# Altium project Turret_Driver.PrjPcb
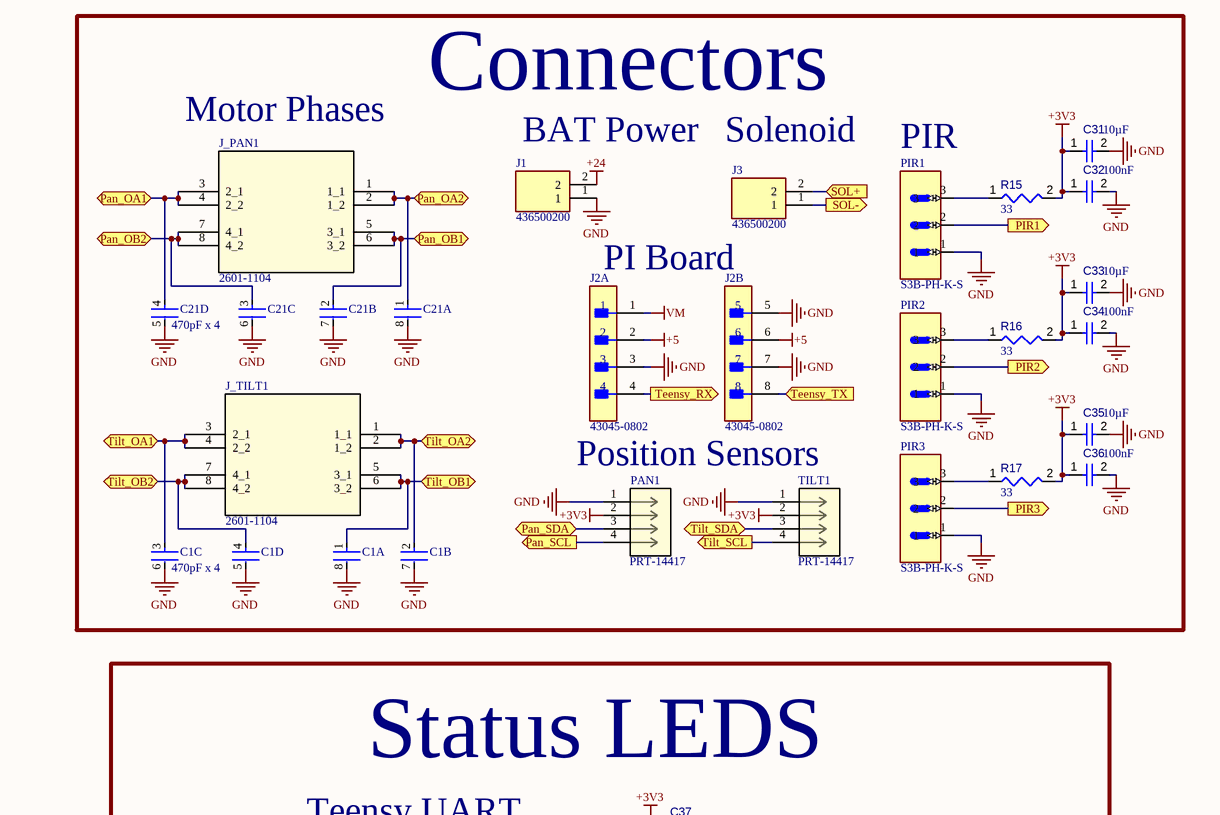
[diagram p0: Main_V1.SchDoc, top right]
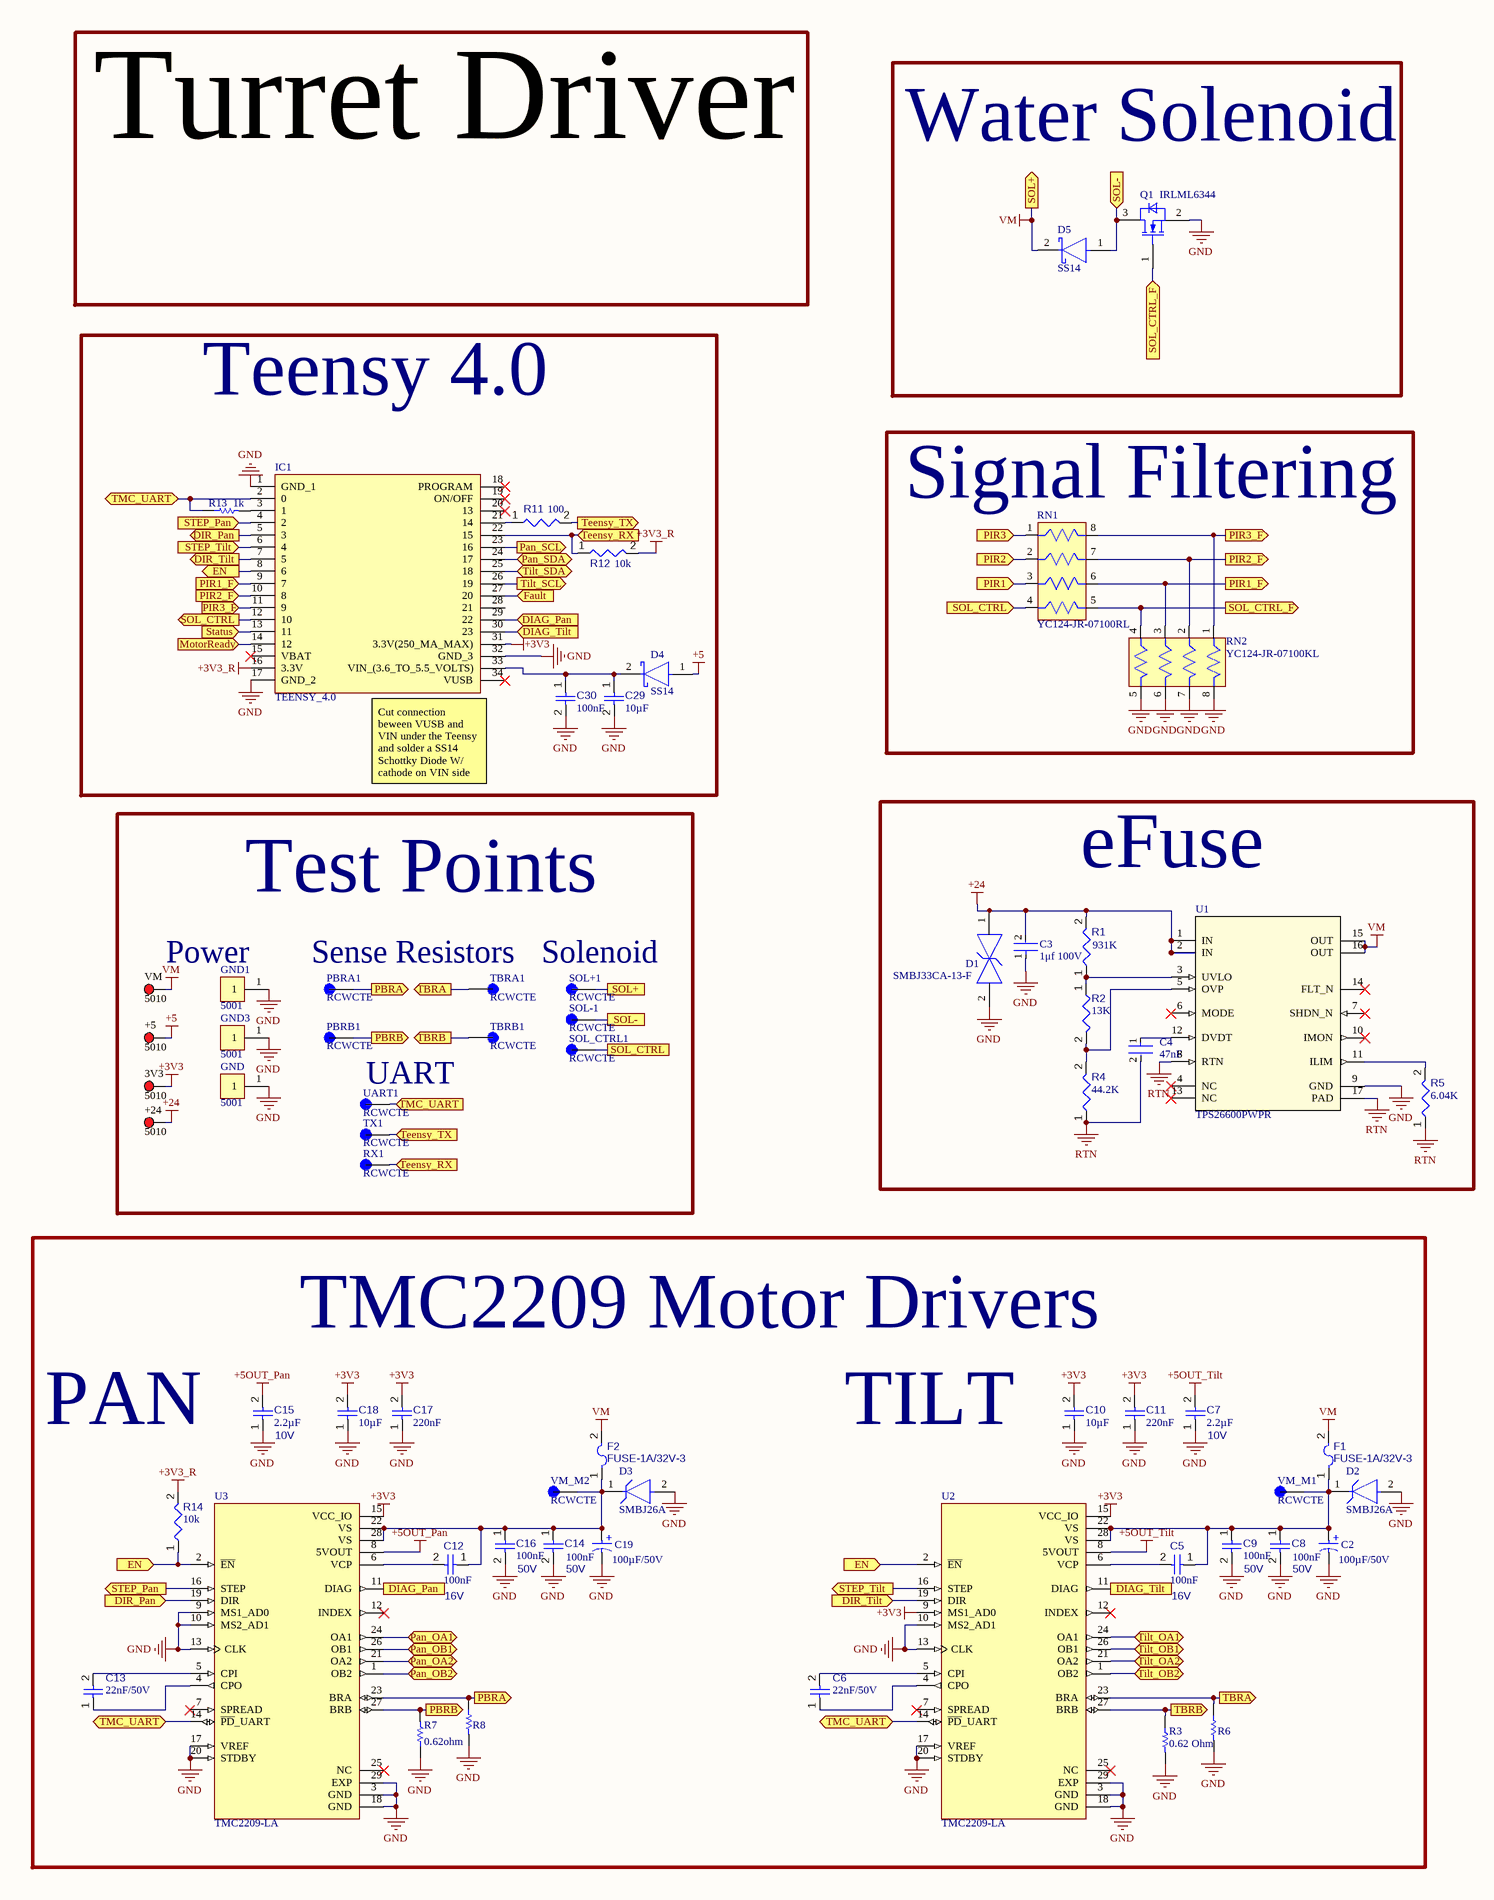
[diagram p1: Main_V1.SchDoc, bottom left]
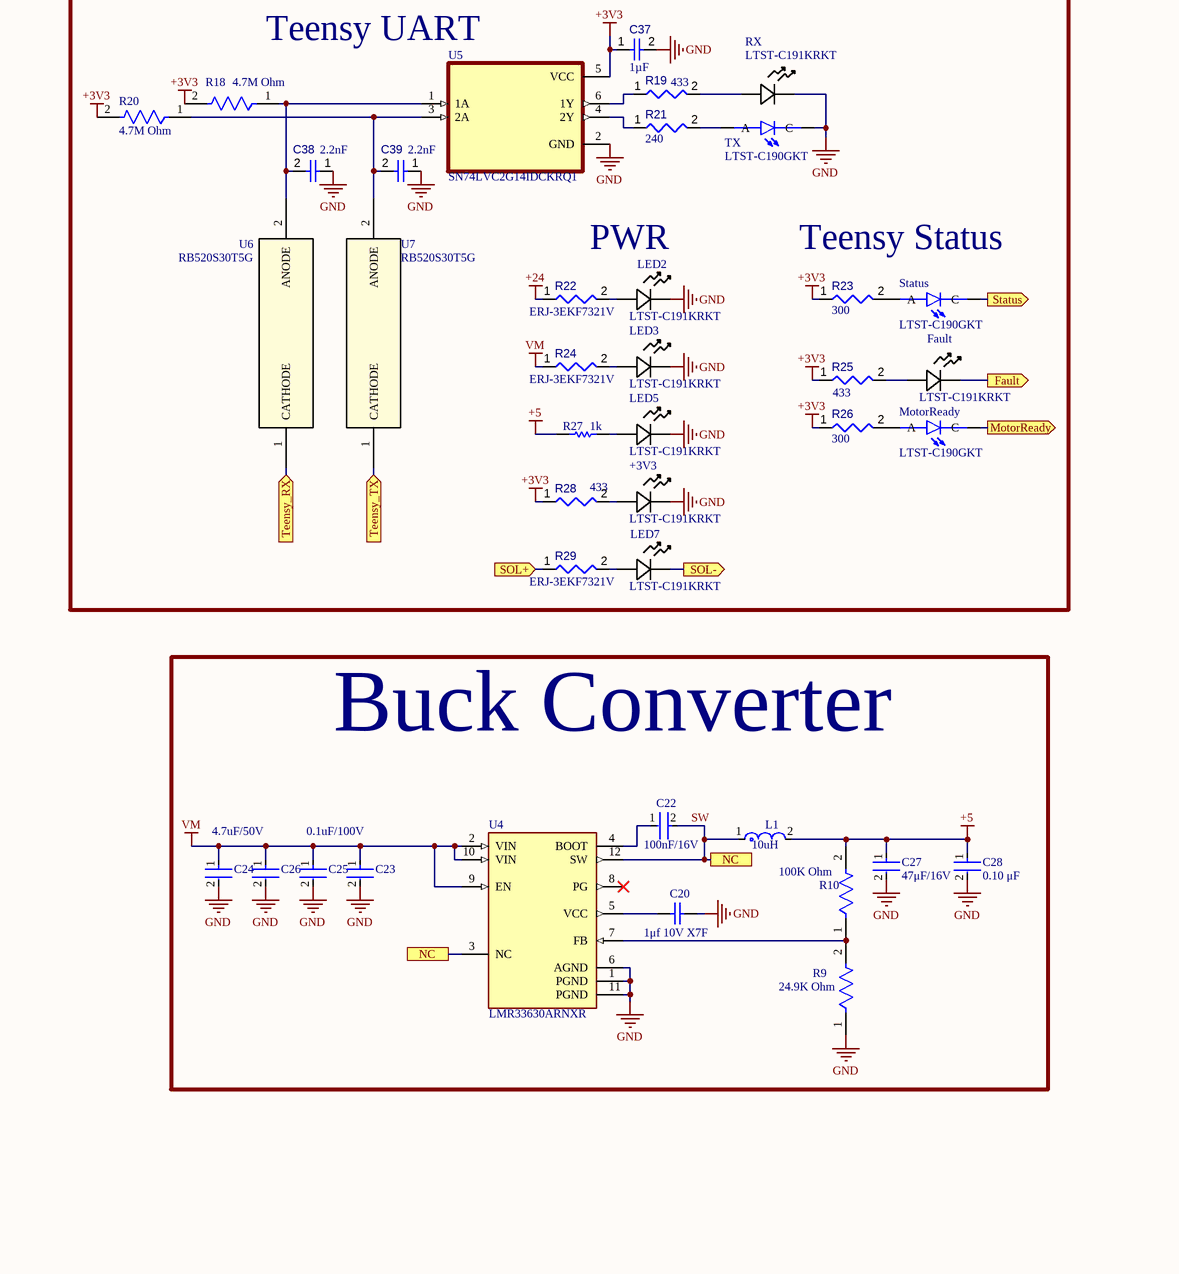
[diagram p2: Main_V1.SchDoc, bottom right]
CAGE_CODE: ?????; CONTRACT_NUMBER: <CONTRACT NO>; DOC_NO_ASSY_DWG: <ASSY DWG NO>; DOC_NO_BOM: <BOM DOC NO>; DOC_NO_FAB_DWG: <FAB DWG NO>; DOC_NO_SCH_DWG: <SCH DWG NO>; PCB_2_DEC_TOL: +/-.01; PCB_3_DEC_TOL: +/-.010; PCB_ANG_TOL: +/-1/2; PCB_ASSEMBLY_NO: <PCB ASSY NO>; PCB_CHECKER: - -----; PCB_CHECKER_APP_DATE: --/--/----; PCB_DESIGNER: - -----; PCB_DESIGNER_APP_DATE: --/--/----; PCB_DWG_NO: <PCB DWG NO>; PCB_ENGINEER: - -----; PCB_ENGINEER_APP_DATE: --/--/----; PCB_PART_NUMBER: <PCB PN>; PCB_REV: A; SCH_REV: A
1 sheet, 126 parts. Net scope: flat (ports and power ports of the same name join across sheets).
Board file: Main_V1.PcbDoc

## Sheet Main_V1.SchDoc: Turret Driver - Teensy 4.0
size 558 x 406 mm; Author: Noah Marchman; CompanyName: Team Evo; DocumentNumber: 1; Revision: B01; SheetNumber: 1; SheetTotal: 1

### Parts
3V3  5010  [KSTN-5010_V]
+3V3  LTST-C191KRKT  [LED_LTST-C191KRKT_LTO]
+5  5010  [KSTN-5010_V]
+24  5010  [KSTN-5010_V]
C1  470pF x 4  [FP-AC0612-MFG]  (parts A,B,C,D of 4)
C2  100µF/50V  [WCAP-ASLI_D6.3H7.7]
C3  1μf 100V  [FP-0805-L_2_0_0_3-W_1_25-IPC_B]
C4  47nF  [FP-C0805C-DN-MFG]
C5  16V  value 100nF  [CAPC0402(1005)60_L]
C6  value 22nF/50V  [CAPC0402(1005)60_L]  (hidden comment: Capacitor 22nF +/-20% 10V 0402)
C7  10V  value 2.2µF  [CAPC0402(1005)60_L]
C8  50V  value 100nF  [CAPC0402(1005)60_L]
C9  50V  value 100nF  [CAPC0402(1005)60_L]
C10  value 10µF  [CAPC0402(1005)60_L]  (hidden comment: Capacitor 10µF +/-40% 6.3V 0402)
C11  value 220nF  [CAPC0402(1005)60_L]  (hidden comment: Capacitor 220nF +/-20% 10V 0402)
C12  16V  value 100nF  [CAPC0402(1005)60_L]
C13  value 22nF/50V  [CAPC0402(1005)60_L]  (hidden comment: Capacitor 22nF +/-20% 10V 0402)
C14  50V  value 100nF  [CAPC0402(1005)60_L]
C15  10V  value 2.2µF  [CAPC0402(1005)60_L]
C16  50V  value 100nF  [CAPC0402(1005)60_L]
C17  value 220nF  [CAPC0402(1005)60_L]  (hidden comment: Capacitor 220nF +/-20% 10V 0402)
C18  value 10µF  [CAPC0402(1005)60_L]  (hidden comment: Capacitor 10µF +/-40% 6.3V 0402)
C19  100µF/50V  [WCAP-ASLI_D6.3H7.7]
C20  1μf 10V X7F  [CAPC1608X90X35LL15T15]
C21  470pF x 4  [FP-AC0612-MFG]  (parts A,B,C,D of 4)
C22  100nF/16V  [FP-GRM15-MFG]
C23  GRM188R72A104KA35D  [FP-GRM188-0_1-e0_2_0_5-IPC_B]  (value not drawn)
C24  4.7uF/50V  [FP-GRM31C-0_2-e0_3_0_8-IPC_C]
C25  0.1uF/100V  [FP-GRM188-0_1-e0_2_0_5-IPC_B]
C26  GRM31CR71H475KA12L  [FP-GRM31C-0_2-e0_3_0_8-IPC_C]  (value not drawn)
C27  47μF/16V  [FP-GRM32E-0_3-0_2-IPC_C]
C28  0.10 μF  [FP-C0805C-DN-MFG]
C29  value 10µF  [CAPC0402(1005)60_L]  (hidden comment: Capacitor 10µF +/-40% 6.3V 0402)
C30  value 100nF  [CAPC0402(1005)60_L]  (hidden comment: Capacitor 100nF +/-20% 50V 0402)
C31  value 10µF  [CAPC0402(1005)60_L]  (hidden comment: Capacitor 10µF +/-40% 6.3V 0402)
C32  value 100nF  [CAPC1005X56X25LL10T15]  (hidden comment: Capacitor 0.1 uF +/- 5% 16 V 0402)
C33  value 10µF  [CAPC0402(1005)60_L]  (hidden comment: Capacitor 10µF +/-40% 6.3V 0402)
C34  value 100nF  [CAPC1005X56X25LL10T15]  (hidden comment: Capacitor 0.1 uF +/- 5% 16 V 0402)
C35  value 10µF  [CAPC0402(1005)60_L]  (hidden comment: Capacitor 10µF +/-40% 6.3V 0402)
C36  value 100nF  [CAPC1005X56X25LL10T15]  (hidden comment: Capacitor 0.1 uF +/- 5% 16 V 0402)
C37  value 1µF  [CAPC1005X55X25ML5T10]  (hidden comment: Capacitor 1 uF +/- 10% 6.3 V 1005)
C38  value 2.2nF  [CAPC0402(1005)60_L]  (hidden comment: Capacitor 220nF +/-20% 10V 0402)
C39  value 2.2nF  [CAPC0402(1005)60_L]  (hidden comment: Capacitor 220nF +/-20% 10V 0402)
D1  SMBJ33CA-13-F  [FP-SMB-CA-MFG]
D2  SMBJ26A  [FP-SMBJ-MFG]
D3  SMBJ26A  [FP-SMBJ-MFG]
D4  SS14  [FP-403AE-MFG]
D5  SS14  [FP-403AE-MFG]
F1  FUSE-1A/32V-3  [LFUS-467_V]
F2  FUSE-1A/32V-3  [LFUS-467_V]
Fault  LTST-C191KRKT  [LED_LTST-C191KRKT_LTO]
GND  5001  [FP-5001-MFG]
GND1  5001  [FP-5001-MFG]
GND3  5001  [FP-5001-MFG]
IC1  TEENSY_4.0  [TEENSY40]
J1  436500200  [MOLEX_436500200]
J2  43045-0802  [FP-43045-0802-MFG]  (parts A,B of 2)
J3  436500200  [MOLEX_436500200]
J_PAN1  2601-1104  [CONN4_2601-1104_WAG]
J_TILT1  2601-1104  [CONN4_2601-1104_WAG]
L1  10uH  [FP-XAL6060-MFG]
LED2  LTST-C191KRKT  [LED_LTST-C191KRKT_LTO]
LED3  LTST-C191KRKT  [LED_LTST-C191KRKT_LTO]
LED5  LTST-C191KRKT  [LED_LTST-C191KRKT_LTO]
LED7  LTST-C191KRKT  [LED_LTST-C191KRKT_LTO]
MotorReady  LTST-C190GKT  [LEDM1608X80]
PAN1  PRT-14417  [CONN_PRT-14417_SPK]
PBRA1  RCWCTE  [TP420X150]
PBRB1  RCWCTE  [TP420X150]
PIR1  S3B-PH-K-S  [S3B-PH-K-S]
PIR2  S3B-PH-K-S  [S3B-PH-K-S]
PIR3  S3B-PH-K-S  [S3B-PH-K-S]
Q1  IRLML6344  [SOT95P237X112-3N-2-V]
R1  value 931K  [RESC0603(1608)_L]  (hidden comment: 120R3J)
R2  13K  [RESC0402(1005)_L]
R3  0.62 Ohm  [RESC2013X50X40NL20T20]
R4  44.2K  [RESC0402(1005)_L]
R5  6.04K  [RESC0402(1005)_L]
R6  RL1220S-R82-F  [RESC2013X50X40NL20T20]  (value not drawn)
R7  RL1220S-R82-F  [RESC2013X50X40NL20T20]  (value not drawn)
R8  0.62ohm  [RESC2013X50X40NL20T20]
R9  24.9K Ohm  [FP-CRCW0402-e3-IPC_C]
R10  100K Ohm  [FP-CRCW0402-e3-IPC_C]
R11  value 100  [RESC0402(1005)_L]  (hidden comment: 100R2F)
R12  value 10k  [RESC0402(1005)_L]  (hidden comment: 10KR2F)
R13  value 1k  [RESC1005X40X25ML05T05]  (hidden comment: Resistor 1k +/-1% 0402 100 mW)
R14  value 10k  [RESC1005X40X25ML05T05]  (hidden comment: Resistor 10k +/-1% 0402 100 mW)
R15  value 33  [RESC0402(1005)_L]  (hidden comment: 33R2J)
R16  value 33  [RESC0402(1005)_L]  (hidden comment: 33R2J)
R17  value 33  [RESC0402(1005)_L]  (hidden comment: 33R2J)
R18  4.7M Ohm  [FP-CRCW0402-e3-IPC_C]
R19  value 433  [RESC0402(1005)_L]  (hidden comment: 240R2J)
R20  4.7M Ohm  [FP-CRCW0402-e3-IPC_C]
R21  value 240  [RESC0402(1005)_L]  (hidden comment: 240R2J)
R22  value ERJ-3EKF7321V  [RESC0603(1608)_L]  (hidden comment: 120R3J)
R23  value 300  [RESC0402(1005)_L]  (hidden comment: 240R2J)
R24  value ERJ-3EKF7321V  [RESC0603(1608)_L]  (hidden comment: 120R3J)
R25  value 433  [RESC0402(1005)_L]  (hidden comment: 240R2J)
R26  value 300  [RESC0402(1005)_L]  (hidden comment: 240R2J)
R27  value 1k  [RESC1005X40X25ML05T05]  (hidden comment: Resistor 1k +/-1% 0402 100 mW)
R28  value 433  [RESC0402(1005)_L]  (hidden comment: 240R2J)
R29  value ERJ-3EKF7321V  [RESC0603(1608)_L]  (hidden comment: 120R3J)
RN1  YC124-JR-07100RL  [RESCAXS50P200X100X55-8N]
RN2  YC124-JR-07100KL  [RESCAXS50P200X100X55-8N]
RX  LTST-C191KRKT  [LED_LTST-C191KRKT_LTO]
RX1  RCWCTE  [TP420X150]
SOL+1  RCWCTE  [TP420X150]
SOL-1  RCWCTE  [TP420X150]
SOL_CTRL1  RCWCTE  [TP420X150]
Status  LTST-C190GKT  [LEDM1608X80]
TBRA1  RCWCTE  [TP420X150]
TBRB1  RCWCTE  [TP420X150]
TILT1  PRT-14417  [CONN_PRT-14417_SPK]
TX  LTST-C190GKT  [LEDM1608X80]
TX1  RCWCTE  [TP420X150]
U1  TPS26600PWPR  [PWP0016H_N]
U2  TMC2209-LA  [QFN50P500X500X90-29N]
U3  TMC2209-LA  [QFN50P500X500X90-29N]
U4  LMR33630ARNXR  [CONV_LMR33630ARNXR]
U5  SN74LVC2G14IDCKRQ1  [SOT65P210X110-6N]
U6  RB520S30T5G  [SOD-523_0P9X1P3_ONS]
U7  RB520S30T5G  [SOD-523_0P9X1P3_ONS]
UART1  RCWCTE  [TP420X150]
VM  5010  [KSTN-5010_V]
VM_M1  RCWCTE  [TP420X150]
VM_M2  RCWCTE  [TP420X150]

### Blocks framed on the sheet
Water Solenoid: D5 Q1
Connectors: C1 C21 C31-C36 J1-J3 J_PAN1 J_TILT1 PAN1 PIR1-PIR3 R15-R17 TILT1
Teensy 4.0: C29 C30 D4 IC1 R11-R13
Signal Filtering: RN1 RN2
Status LEDS: +3V3 C37-C39 Fault LED2 LED3 LED5 LED7 MotorReady R18-R29 RX Status TX U5-U7
Test Points: 3V3 +5 +24 GND GND1 GND3 PBRA1 PBRB1 RX1 SOL+1 SOL-1 SOL_CTRL1 TBRA1 TBRB1 TX1 UART1 VM
eFuse: C3 C4 D1 R1 R2 R4 R5 U1
Buck Converter: C20 C22-C28 L1 R9 R10 U4

### Ports
DIAG_Pan (in), DIAG_Pan (out), DIAG_Tilt (in), DIAG_Tilt (out), DIR_Pan (in), DIR_Pan (out), DIR_Tilt (in), DIR_Tilt (out), EN (in), EN (out), Fault (in), Fault (out), MotorReady (in), MotorReady (out), NC, Pan_OA1 (bidir), Pan_OA2 (bidir), Pan_OB1 (bidir), Pan_OB2 (bidir), Pan_SCL (out), Pan_SDA (bidir), PBRA (out), PBRB (out), PIR1 (in), PIR1 (out), PIR1_F (in), PIR1_F (out), PIR2 (in), PIR2 (out), PIR2_F (in), PIR2_F (out), PIR3 (in), PIR3 (out), PIR3_F (in), PIR3_F (out), SOL+, SOL+ (in), SOL+ (out), SOL-, SOL- (in), SOL- (out), SOL_CTRL, SOL_CTRL (in), SOL_CTRL (out), SOL_CTRL_F (in), SOL_CTRL_F (out), Status (in), Status (out), STEP_Pan (in), STEP_Pan (out), STEP_Tilt (in), STEP_Tilt (out), TBRA (out), TBRB (out), Teensy_RX (in), Teensy_RX (out), Teensy_TX (in), Teensy_TX (out), Tilt_OA1 (bidir), Tilt_OA2 (bidir), Tilt_OB1 (bidir), Tilt_OB2 (bidir), Tilt_SCL (out), Tilt_SDA (bidir), TMC_UART (bidir), TMC_UART (in)

### Nets
+3V3: 3V3.1 C10.2 C11.2 C17.2 C18.2 C31.1 C32.1 C33.1 C34.1 C35.1 C36.1 C37.1 IC1.31(3.3V(250_MA_MAX)) PAN1.2 R15.2 R16.2 R17.2 R18.2 R20.2 R23.1 R25.1 R26.1 R28.1 TILT1.2 U2.9(MS1_AD0) U2.15(VCC_IO) U3.15(VCC_IO) U5.5(VCC)
+3V3_R: IC1.16(3.3V) R12.2 R14.2
+5: +5.1 C27.1 C28.1 D4.1(A) J2.2 J2.6 L1.2 R10.2 R27.1
+5OUT_Pan: C15.2 U3.8(5VOUT)
+5OUT_Tilt: C7.2 U2.8(5VOUT)
+24: +24.1 C3.2 D1.1 J1.2 R1.2 R22.1 U1.1(IN) U1.2(IN)
GND: +3V3.1 C1.5 C1.6 C1.7 C1.8 C2.2(N) C3.1 C7.1 C8.2 C9.2 C10.1 C11.1 C14.2 C15.1 C16.2 C17.1 C18.1 C19.2(N) C20.2 C21.5 C21.6 C21.7 C21.8 C23.2 C24.2 C25.2 C26.2 C27.2 C28.2 C29.2 C30.2 C31.2 C32.2 C33.2 C34.2 C35.2 C36.2 C37.2 C38.1 C39.1 D1.2 D2.2(A) D3.2(A) GND.1 GND1.1 GND3.1 IC1.1(GND_1) IC1.17(GND_2) IC1.32(GND_3) J1.1 J2.3 J2.5 J2.7 LED2.1 LED3.1 LED5.1 PAN1.1 PIR1.1 PIR2.1 PIR3.1 Q1.2(SOURCE) R3.2 R6.2 R7.1 R8.2 R9.1 RN2.5 RN2.6 RN2.7 RN2.8 RX.1 TILT1.1 TX.C U1.9(GND) U2.3(GND) U2.10(MS2_AD1) U2.13(CLK) U2.17(VREF) U2.18(GND) U2.20(STDBY) U2.29(EXP) U3.3(GND) U3.9(MS1_AD0) U3.10(MS2_AD1) U3.13(CLK) U3.17(VREF) U3.18(GND) U3.20(STDBY) U3.29(EXP) U4.1(PGND) U4.6(AGND) U4.11(PGND) U5.2(GND)
RTN: C4.2 R4.1 R5.1 U1.8(RTN) U1.17(PAD)
VM: C23.1 C24.1 C25.1 C26.1 D5.2(C) F1.2 F2.2 J2.1 J3.2 R24.1 R29.1 SOL+1.1(TP) U1.15(OUT) U1.16(OUT) U4.2(VIN) U4.9(EN) U4.10(VIN) VM.1 ; port SOL+
DIAG_Pan: IC1.29(22) U3.11(DIAG) ; port DIAG_Pan
DIAG_Tilt: IC1.30(23) U2.11(DIAG) ; port DIAG_Tilt
DIR_Pan: IC1.5(3) U3.19(DIR) ; port DIR_Pan
DIR_Tilt: IC1.7(5) U2.19(DIR) ; port DIR_Tilt
EN: IC1.8(6) R14.1 U2.2(~{EN}) U3.2(~{EN}) ; port EN
Fault: Fault.1 IC1.27(20) ; port Fault
MotorReady: IC1.14(12) MotorReady.C ; port MotorReady
Pan_OA1: C21.4 J_PAN1.3(2_1) J_PAN1.4(2_2) U3.24(OA1) ; port Pan_OA1
Pan_OA2: C21.1 J_PAN1.1(1_1) J_PAN1.2(1_2) U3.21(OA2) ; port Pan_OA2
Pan_OB1: C21.2 J_PAN1.5(3_1) J_PAN1.6(3_2) U3.26(OB1) ; port Pan_OB1
Pan_OB2: C21.3 J_PAN1.7(4_1) J_PAN1.8(4_2) U3.1(OB2) ; port Pan_OB2
Pan_SCL: IC1.23(16) PAN1.4 ; port Pan_SCL
Pan_SDA: IC1.24(17) PAN1.3 ; port Pan_SDA
PBRA: PBRA1.1(TP) R8.1 U3.23(BRA) ; port PBRA
PBRB: PBRB1.1(TP) R7.2 U3.27(BRB) ; port PBRB
PIR1: PIR1.2 RN1.3 ; port PIR1
PIR1_F: IC1.9(7) RN1.6 RN2.3 ; port PIR1_F
PIR2: PIR2.2 RN1.2 ; port PIR2
PIR2_F: IC1.10(8) RN1.7 RN2.2 ; port PIR2_F
PIR3: PIR3.2 RN1.1 ; port PIR3
PIR3_F: IC1.11(9) RN1.8 RN2.1 ; port PIR3_F
SOL-: D5.1(A) J3.1 LED7.1 Q1.3(DRAIN) SOL-1.1(TP) ; port SOL-
SOL_CTRL: IC1.12(10) RN1.4 SOL_CTRL1.1(TP) ; port SOL_CTRL
SOL_CTRL_F: Q1.1(GATE) RN1.5 RN2.4 ; port SOL_CTRL_F
Status: IC1.13(11) Status.C ; port Status
STEP_Pan: IC1.4(2) U3.16(STEP) ; port STEP_Pan
STEP_Tilt: IC1.6(4) U2.16(STEP) ; port STEP_Tilt
SW: C22.2 L1.1 U4.3(NC) U4.12(SW) ; port NC
TBRA: R6.1 TBRA1.1(TP) U2.23(BRA) ; port TBRA
TBRB: R3.1 TBRB1.1(TP) U2.27(BRB) ; port TBRB
Teensy_RX: IC1.22(15) J2.4 R12.1 RX1.1(TP) U6.1(CATHODE) ; port Teensy_RX
Teensy_TX: J2.8 R11.2 TX1.1(TP) U7.1(CATHODE) ; port Teensy_TX
Tilt_OA1: C1.3 J_TILT1.3(2_1) J_TILT1.4(2_2) U2.24(OA1) ; port Tilt_OA1
Tilt_OA2: C1.2 J_TILT1.1(1_1) J_TILT1.2(1_2) U2.21(OA2) ; port Tilt_OA2
Tilt_OB1: C1.1 J_TILT1.5(3_1) J_TILT1.6(3_2) U2.26(OB1) ; port Tilt_OB1
Tilt_OB2: C1.4 J_TILT1.7(4_1) J_TILT1.8(4_2) U2.1(OB2) ; port Tilt_OB2
Tilt_SCL: IC1.26(19) TILT1.4 ; port Tilt_SCL
Tilt_SDA: IC1.25(18) TILT1.3 ; port Tilt_SDA
TMC_UART: IC1.2(0) R13.1 U2.14(~{PD}_UART) U3.14(~{PD}_UART) UART1.1(TP) ; port TMC_UART
Net+3V3_2: +3V3.2 R28.2
NetC2_1: C2.1(P) C5.1 C8.1 C9.1 D2.1(C) F1.1 U2.22(VS) U2.28(VS) VM_M1.1(TP)
NetC4_1: C4.1 U1.12(DVDT)
NetC5_2: C5.2 U2.6(VCP)
NetC6_1: C6.1 U2.4(CPO)
NetC6_2: C6.2 U2.5(CPI)
NetC12_1: C12.1 C14.1 C16.1 C19.1(P) D3.1(C) F2.1 U3.22(VS) U3.28(VS) VM_M2.1(TP)
NetC12_2: C12.2 U3.6(VCP)
NetC13_1: C13.1 U3.4(CPO)
NetC13_2: C13.2 U3.5(CPI)
NetC20_1: C20.1 U4.5(VCC)
NetC22_1: C22.1 U4.4(BOOT)
NetC29_1: C29.1 C30.1 D4.2(C) IC1.33(VIN_(3.6_TO_5.5_VOLTS))
NetC38_2: C38.2 R18.1 U5.1(1A) U6.2(ANODE)
NetC39_2: C39.2 R20.1 U5.3(2A) U7.2(ANODE)
NetFault_2: Fault.2 R25.2
NetIC1_3: IC1.3(1) R13.2
NetIC1_21: IC1.21(14) R11.1
NetLED2_2: LED2.2 R22.2
NetLED3_2: LED3.2 R24.2
NetLED5_2: LED5.2 R27.2
NetLED7_2: LED7.2 R29.2
NetMotorReady_A: MotorReady.A R26.2
NetPIR1_3: PIR1.3 R15.1
NetPIR2_3: PIR2.3 R16.1
NetPIR3_3: PIR3.3 R17.1
NetR1_1: R1.1 R2.1 U1.3(UVLO)
NetR2_2: R2.2 R4.2 U1.5(OVP)
NetR5_2: R5.2 U1.11(ILIM)
NetR9_2: R9.2 R10.1 U4.7(FB)
NetR19_1: R19.1 U5.6(1Y)
NetR19_2: R19.2 RX.2
NetR21_1: R21.1 U5.4(2Y)
NetR21_2: R21.2 TX.A
NetR23_2: R23.2 Status.A

Not connected (* = marked no-connect by the designer): IC1 15(VBAT)* 18(PROGRAM)* 19(ON/OFF)* 20(13)* 28(21) 34(VUSB)*; U1 4(NC)* 6(MODE)* 7(SHDN_N)* 10(IMON)* 13(NC)* 14(FLT_N)*; U2 7(SPREAD)* 12(INDEX)* 25(NC)*; U3 7(SPREAD)* 12(INDEX)* 25(NC)*; U4 8(PG)*

### Notes on the sheet
- Motor Phases
- (near J1) BAT Power
- (near J3) Solenoid
- PIR
- Turret Driver
  Schematic
- (near J2) PI Board
- Position Sensors
- (near IC1) Cut connection beween VUSB and VIN under the Teensy and solder a SS14 Schottky Diode W/ cathode on VIN side
- (near U5) Teensy UART
- Power
- Sense Resistors
- (near SOL+1) Solenoid
- PWR
- Teensy Status
- (near UART1) UART
- TMC2209 Motor Drivers
- PAN
- TILT
- (in symbol CMP-03913-54202496-2) +

### Library data of the parts
3V3 +5 +24 VM = CMP-1672-00002-4: Test Point, Red, Through Hole, RoHS, Bulk; Manufacturer: Keystone; Contact Material: Bronze; Mounting Technology: Through Hole; RoHSCompliant: true; Pins: 1; Package Quantity: 100; ComponentLink2Description: Datasheet; Height: 8.12 mm; ComponentLink1URL: http://www.keyelco.com/; DatasheetVersion: Rev. F, 12/2013; Mount: Through Hole; PackageReference: 5010; Contact Plating: Silver; Packaging: Bulk; Colour: Red; REACH SVHC: No SVHC; PackageDescription: 1-Pin Through Hole Device, Dia 3.17 mm; ComponentLink2URL: http://www.keyelco.com/product-pdf.cfm?p=1319; ComponentLink1Description: Manufacturer URL
+3V3 Fault LED2 LED3 LED5 LED7 RX = LTST-C191KRKT: Description; Manufacturer_Name: LITE-ON; Copyright: Copyright (C) 2025 Ultra Librarian. All rights reserved.; Manufacturer_Part_Number: LTST-C191KRKT
C1 = CMP-03425-000006-1: AC0612 220 pF NP0 5.00% 50 V; Manufacturer: Yageo; Manufacturer Part Number: AC0612JRNPO9BN221; Voltage Rating: 50 V; Material: Ceramic; Capacitance: 220 pF; Temperature Coefficient: 30ppm/°C; Tolerance: 0.05; Value: 220 pF; Automotive Grade: Grade 1; ComponentLink2Description: Datasheet; Device Class L2: Capacitors; Temperature Range Low: -55°C; Package: AC0612; Automotive: Yes; Footprint Url: http://www.yageo.com/exep/pages/download/literatures/UPY-C_GEN_24.pdf; Category: Cap; Temperature Range High: +125°C; Octopart: https://octopart.com/ac0612jrnpo9bn221-yageo-75656623; Lead Free: Yes; Height: 0.9mm; Device Class L3: Capacitor Arrays; RoHS: TRUE; Device Class L1: Passive Components; ComponentLink2URL: http://www.yageo.com/documents/recent/UPY-AC_NP0X7R_16V-to-630V_12.pdf; Temperature: -55°C to +125°C; Temperature Characteristic: NP0
C2 C19 = CMP-03913-54202496-2: Cap Aluminum Lytic 100uF 35V 20% (6.3 X 7.7mm) SMD 300mA 2000h 105C T/R; Capacitance: 100µF; Impedance: 380mΩ; Insulation Resistance: 1MΩ; ESR (Equivalent Series Resistance): 321.392mΩ; Dissipation Factor: 14%; Leakage Current: 35µA; Life (Hours): 2000hours; Min Operating Temperature: -55°C; Height: 7.7mm; Tolerance: 20%; Ripple Current (AC): 300mA; Length: 7.7mm; Width: 6.6mm; Voltage Rating: 35V; REACH SVHC: Unknown; Ripple Current: 300mA; Diameter: 6.3mm; Max Operating Temperature: 105°C; RoHS: Compliant; Voltage Rating (DC): 35V; Packaging: Cut Tape; Case/Package: Radial
C3 = CMP-14477-003884-2: None
C4 = CMP-03020-021891-1: C0805 47,000 pF U2J 30ppm/°C 1.00% 50 V; Manufacturer Part Number: C0805C473F5JACAUTO; Manufacturer: KEMET; Voltage Rating: 50 V; Material: Ceramic; Tolerance: 0.01; Capacitance: 47,000 pF; Temperature Coefficient: 30ppm/°C; Temperature Range Low: -55°C; ComponentLink2Description: Datasheet; Temperature: -55°C to +125°C; Automotive: No; Category: Cap; Value: 47,000 pF; Ipc Land Pattern Name: CAPC200125X78; Octopart: https://octopart.com/c0805c473f5jacauto-kemet-84731962; Temperature Characteristic: U2J; Device Class L1: Passive Components; Device Class L3: Ceramic Capacitors; ComponentLink2URL: https://content.kemet.com/datasheets/KEM_C1003_C0G_SMD.pdf; RoHS: TRUE; Height: 0.88mm; Package: C0805C-DN; Temperature Range High: +125°C; Lead Free: Yes; Device Class L2: Capacitors
C5 C8 C9 C12 C14 C16 C30 = CMP-001-00067-3: Chip Capacitor, 100nF +/-20%, 50V, 0402, Thickness 0.6 mm; Tolerance: 10%; Min Operating Temperature: -55°C; Pins: 2; Case/Package: 0402; Max Operating Temperature: 85°C; Voltage Rating: 50V; Mounting Technology: SMT
C6 C13 = CMP-001-00062-3: Chip Capacitor, 22nF +/-20%, 10V, 0402, Thickness 0.6 mm; Tolerance: 10%; Min Operating Temperature: -55°C; Case/Package: 0402; Pins: 2; Max Operating Temperature: 85°C; Mounting Technology: SMT; Voltage Rating: 10V
C7 C15 = CMP-001-00056-4: Chip Capacitor, 2,2µF +/-20%, 10V, 0402, Thickness 0.6 mm; Tolerance: 10%; Mounting Technology: SMT; Max Operating Temperature: 85°C; Case/Package: 0402; Pins: 2; Min Operating Temperature: -55°C; Voltage Rating: 10V
C10 C18 C29 C31 C33 C35 = CMP-001-00074-3: Chip Capacitor, 10µF +/-40%, 6.3V, 0402, Thickness 0.6 mm; Tolerance: 10%; Case/Package: 0402; Pins: 2; Mounting Technology: SMT; Voltage Rating: 6.3V; Max Operating Temperature: 85°C; Min Operating Temperature: -55°C
C11 C17 = CMP-001-00057-3: Chip Capacitor, 220nF +/-20%, 10V, 0402, Thickness 0.6 mm; Tolerance: 10%; Max Operating Temperature: 85°C; Pins: 2; Case/Package: 0402; Mounting Technology: SMT; Voltage Rating: 10V; Min Operating Temperature: -55°C
C20 = CMP-2006-04500-1: Manufacturer: AVX Interconnect / Elco; Part Number: 0603YC105MAT2A
C21 = CMP-03425-000006-1: Manufacturer: Yageo; Manufacturer Part Number: AC0612JRNPO9BN221; Voltage Rating: 50 V; Material: Ceramic; Capacitance: 220 pF; Temperature Coefficient: 30ppm/°C; Tolerance: 0.05; Value: 220 pF; Temperature Characteristic: NP0; Automotive Grade: Grade 1; ComponentLink2Description: Datasheet; Device Class L2: Capacitors; Temperature Range Low: -55°C; Package: AC0612; Automotive: Yes; Footprint Url: http://www.yageo.com/exep/pages/download/literatures/UPY-C_GEN_24.pdf; Category: Cap; Temperature Range High: +125°C; Octopart: https://octopart.com/ac0612jrnpo9bn221-yageo-75656623; Lead Free: Yes; Height: 0.9mm; Device Class L3: Capacitor Arrays; RoHS: TRUE; Device Class L1: Passive Components; ComponentLink2URL: http://www.yageo.com/documents/recent/UPY-AC_NP0X7R_16V-to-630V_12.pdf; Temperature: -55°C to +125°C
C22 = CMP-2100-03641-2: CAP CER 0.1UF 16V X7R 0402; Manufacturer Part Number: GRM155R71C104KA88D; Manufacturer: Murata; Standoff Height: 0mm; Tolerance: 10%; Voltage Rating: 16Vdc; Material: Ceramic; Capacitance: 0.10μF; Value: 0.10μF; RoHS: TRUE; Temperature Characteristic: X7R; Octopart: https://octopart.com/grm155r71c104ka88d-murata-196880; Digikey Description: CAP CER 0.1UF 16V X7R 0402; Device Class L3: Ceramic Capacitors; Height: 0.55mm; ComponentLink2Description: Datasheet; Temperature Range Low: -55°C; Ipc Land Pattern Name: CAPC10050X219; ComponentLink2URL: https://search.murata.co.jp/Ceramy/image/img/A01X/G101/ENG/GRM155R71H471KA01-01A.pdf; Device Class L1: Passive Components; Lead Free: yes; Category: Cap; Package: GRM15; Temperature: -55°C to +125°C; Device Class L2: Capacitors; Temperature Range High: +125°C; Mouser Description: 0402 0.1 uF 16V ±10 % Tolerance X7R SMT Multilayer Ceramic Capacitor
C23 C25 = CMP-1035-02595-8: Chip Multilayer Ceramic Capacitors for General Purpose, 0603, 0.10uF, X7R, 15%, 10%, 100V; Capacitance: 100nF; Voltage Rating (DC): 100V; Material: Ceramic; Packaging: Tape and Reel; Dielectric: X7R; Case Code (Imperial): 0603; Package Quantity: 1; Height: 0.8mm; Weight: 0.000222oz; Min Operating Temperature: -55°C; Depth: 0.8mm; Mount: Surface Mount; Thickness: 0.035inch; Voltage: 100V; REACH SVHC: No SVHC; Case/Package: 0603; Voltage Rating: 100V; Width: 0.8mm; Tolerance: 10%; Lead Free: Lead Free; Case Code (Metric): 1608; Radiation Hardening: No; Max Operating Temperature: 125°C; Termination: SMD/SMT; Length: 1.6mm
C24 C26 = CMP-1037-04923-3: Chip Multilayer Ceramic Capacitors for General Purpose, 1206, 4.7uF, X7R, 15%, 10%, 50V; Height: 1.6mm; Voltage: 50V; Capacitance: 4.7uF; Lead Free: Lead Free; Max Operating Temperature: 125°C; Packaging: Tape and Reel; REACH SVHC: No SVHC; Voltage Rating: 50V; Mount: Surface Mount; Termination: SMD/SMT; Tolerance: 10%; Case/Package: 1206; Material: Ceramic; Depth: 1.6mm; Length: 3.2mm; Case Code (Metric): 3216; Voltage Rating (DC): 50V; Case Code (Imperial): 1206; Radiation Hardening: No; Width: 0.063inch; Thickness: 0.071inch; Package Quantity: 2000; Min Operating Temperature: -55°C; Dielectric: X7R
C27 = CMP-2000-06362-2: CAP CER 47UF 16V X5R 1210; Tolerance: 10%; Material: Ceramic; Case Code (Metric): 3225; RoHS Compliant: Yes; Min Operating Temperature: -55°C; Radiation Hardening: No; Voltage: 16V; Package Quantity: 1; Case Code (Imperial): 1210; REACH SVHC: No SVHC; Capacitance: 47uF; Voltage Rating (DC): 16V; Dielectric: X5R; Case/Package: 1210; Length: 3.2mm; Voltage Rating: 16V; Packaging: Cut Tape; Width: 0.098inch; Number of Pins: 2; Lead Free: Lead Free; Height: 2.5mm; Mount: Surface Mount; Termination: SMD/SMT; Max Operating Temperature: 85°C; Thickness: 0.106inch; Depth: 2.5mm
C28 = CMP-1036-04423-3: CAP CER 0.1UF 50V X7R 0805; Manufacturer Part Number: C0805C104M5RACTU; Manufacturer: KEMET; Tolerance: 0.2; Temperature Coefficient: 30ppm/°C; Material: Ceramic; Temperature: -55°C to +125°C; RoHS: TRUE; Temperature Range Low: -55°C; Device Class L3: Ceramic Capacitors; Octopart: https://octopart.com/c0805c104m5ractu-kemet-129379; Ipc Land Pattern Name: CAPC200125X78; Mouser Description: Multilayer Ceramic Capacitors MLCC - SMD/SMT 50volts 0.1uF X7R 20%; Temperature Range High: +125°C; Package: C0805C-DN; Capacitance: 0.10 μF; Value: 0.10 μF; Temperature Characteristic: X7R; Automotive: No; ComponentLink2URL: https://content.kemet.com/datasheets/KEM_C1003_C0G_SMD.pdf; Device Class L1: Passive Components; ComponentLink2Description: Datasheet; Device Class L2: Capacitors; Voltage Rating: 50 V; Digikey Description: CAP CER 0.1UF 50V X7R 0805; Lead Free: Yes; Height: 0.88mm; Category: Cap
C32 C34 C36 = CMP-001-00001-6: Chip Capacitor, 0.1 uF, +/- 5%, 16 V, 0402 (1005 Metric); Capacitor Type: Ceramic; Voltage Rating: 16V; Max Operating Temperature: 125°C; Min Operating Temperature: -55°C; Case/Package: 0402; Mounting Technology: SM; Pins: 2; Tolerance: 5%; RoHS Compliant: True
C37 = CMP-001-00009-6: Chip Capacitor, 1 uF, +/- 10%, 6.3 V, 1005 (0402 Metric); Voltage Rating: 6.3V; Capacitor Type: Ceramic; Min Operating Temperature: -55°C; Case/Package: 0402; Tolerance: 10%; Mounting Technology: SM; Max Operating Temperature: 85°C; RoHS Compliant: True; Pins: 2
C38 C39 = CMP-001-00057-3: Tolerance: 10%; Max Operating Temperature: 85°C; Pins: 2; Case/Package: 0402; Mounting Technology: SMT; Voltage Rating: 10V; Min Operating Temperature: -55°C
D1 = CMP-12828-000022-1: TVS DIODE 33V 53.3V SMB; Leakage Current: 5uA; ESD Protection: No; Element Configuration: Single; Direction: Bidirectional; Power Dissipation: 600W; Number of Elements: 1; Reverse Breakdown Voltage: 36.7V; Max Breakdown Voltage: 42.2V; Peak Pulse Current: 11.3A; Test Current: 1mA; Capacitance: 800pF; Case/Package: SMB; Contact Plating: Tin; Termination: SMD/SMT; Height: 2.62mm; Power Line Protection: No; Width: 3.9mm; Polarity: Bidirectional; Working Voltage: 33V; Packaging: Tape and Reel; Max Power Dissipation: 600W; Mount: Surface Mount; Min Operating Temperature: -55°C; Breakdown Voltage: 42.2V; Lead Free: Lead Free; Peak Pulse Power: 600W; Voltage Rating (DC): 33V; Max Reverse Leakage Current: 5uA; Max Output Current: 11.3A; Max Operating Temperature: 150°C; Package Quantity: 3000; Radiation Hardening: No; Number of Bidirectional Channels: 1; Min Breakdown Voltage: 36.7V; Length: 4.57mm; Clamping Voltage: 53.3V; Number of Pins: 2; Reverse Standoff Voltage: 33V; Max Surge Current: 11.3A; Composition: Zener
D2 D3 = CMP-08607-000063-1: TVS DIODE 26V 42.1V DO214AA; Manufacturer: Littelfuse; Breakdown Voltage: 28.9V; Peak Pulse Power: 600W; Peak Pulse Current: 14.3A; Direction: Unidirectional; Number Of Channels: 1; Max Junction Temp: +150°C; Lead Free: Yes; Device Class L1: Circuit Protection; Height: 2.61mm; Device Class L3: unset; Reverse Standoff Voltage: 26V; ComponentLink2URL: https://www.littelfuse.com/~/media/electronics/datasheets/tvs_diodes/littelfuse_tvs_diode_smbj_datasheet.pdf.pdf; Automotive: No; Octopart: https://octopart.com/smbj26a-littelfuse-350771; Device Class L2: TVS Diodes; Clamping Voltage: 42.1V; Manufacturer Part Number: SMBJ26A; Temperature Range High: +150°C; Category: Diode; RoHS: TRUE; Temperature: -65°C to +150°C; Mouser Description: TVS Diodes - Transient Voltage Suppressors 26Vr 600W 14.3A 5% UniDirectional; Package: SMBJ; Digikey Description: TVS DIODE 26V 42.1V DO214AA; Temperature Range Low: -65°C; ComponentLink2Description: Datasheet
D4 D5 = CMP-2000-04943-2: DIODE SCHOTTKY 40V 1A SMA; Manufacturer: ON Semiconductor; Peak Reverse Current: 0.2mA; Max Junction Temp: +125°C; Standoff Height: 0.05mm; Max Surge Forward Current: 40A; Mouser Description: Schottky Diodes & Rectifiers SMA 40V 1.0A; RoHS: TRUE; Lead Free: Yes; Manufacturer Part Number: SS14; Device Class L3: Schottky Diodes; Category: Diode; Automotive: No; Digikey Description: DIODE SCHOTTKY 40V 1A SMA; ComponentLink2Description: Datasheet; Device Class L2: Diodes; Height: 2.5mm; Temperature Range High: +125°C; ComponentLink2URL: https://www.onsemi.com/pub/Collateral/SS19-D.PDF; Device Class L1: Discrete Semiconductors; Package: 403AE; Octopart: https://octopart.com/ss14-on+semiconductor-29205033; Max Repetitive Reverse Voltage: 40V; Temperature Range Low: -65°C; Forward Current: 1A; Temperature: -65°C to +125°C
F1 F2 = CMP-005-00012-2: Fast Acting Fuse, 1 A, 32 V, -55 to 90 degC, 2-Pin SMD, RoHS, Tape and Reel; Current Rating: 1A; Case/Package: LFUS-467; Pins: 2
GND GND1 GND3 = CMP-2000-05181-2: PC TEST POINT MINIATURE BLACK; Body Material: Bronze; Plating: Silver; Inside Diameter: 1.27mm; Hole Diameter: 1.6mm; Number of Ports: 1; Outside Diameter: 2.54mm; Insulation: Insulated; Insulation Material: Nylon; Mount: Through Hole; RoHS Compliant: Yes; Series: THM; Height: 0.3inch; Termination: Through Hole; Material: Nylon; Packaging: Bulk; Contact Material: Bronze; REACH SVHC: No SVHC; Contact Plating: Silver; Orientation: Straight; Lead Free: Lead Free; Package Quantity: 100; Length: 7.62mm; Flammability Rating: UL94 V-0; Number of Contacts: 1; Diameter: 2.54mm; Housing Color: Black; Color: Black
IC1 = TEENSY_4.0: Integrated Circuit; Manufacturer_Name: Teensy; Manufacturer_Part_Number: TEENSY 4.0; Datasheet Link: https://www.pjrc.com/store/teensy40.html; Height: 4.64mm
J1 J3 = 436500200: Connector Header Through Hole, Right Angle 2 position 0.118 (3.00mm); MF: Molex; SnapEDA_Link: https://www.snapeda.com/parts/436500200/Molex/view-part/?ref=snap; Package: None; Value: *; MP: 436500200; Check_prices: https://www.snapeda.com/parts/436500200/Molex/view-part/?ref=eda
J2 = CMP-04776-000999-1: CONN HEADER R/A 8POS 3MM; Current Rating: 5A; Insulation Resistance: 1GR; Max Voltage Rating (DC): 250.25kV; Number of Circuits: 8; Contact Resistance: 10mR; Voltage Rating: 250V; Gender: Male; Glow Wire Compliant: Compliant; Connector Type: Plug; Case/Package: 0802; Contact Material: Brass; Max Operating Temperature: 105°C; Color: Black; Housing Material: Thermoplastic; Depth: 12.2mm; Packaging: Tray; Length: 16.15mm; Series: Micro-Fit 3.0; Lead Free: Lead Free; Number of Contacts: 8; Pitch: 3mm; Contact Plating: Gold; Diameter: 3mm; Halogen Free: Low Halogen; Row Spacing: 3mm; Max Current Rating: 5A; Min Operating Temperature: -40°C; Height: 8.77mm; Radiation Hardening: No; Orientation: Right Angle; RoHS Compliant: Yes; Number of Positions: 8; Package Quantity: 1440; Termination: Solder; Mount: Through Hole; Voltage Rating (DC): 250V; Reach SVHC Compliant: Yes; Number of Rows: 2; Housing Color: Black; Flammability Rating: UL94 V-0
J_PAN1 J_TILT1 = 2601-1104: Description; Manufacturer_Name: Wago; Copyright: Copyright (C) 2026 Ultra Librarian. All rights reserved.; Manufacturer_Part_Number: 2601-1104; RefDes: RefDes; Type: Type
L1 = CMP-11268-000112-1: Power inductor, shielded,10uH 20% tol, 29.82mOhms, SMT, RoHS, Halogen Free, AEC - Q200; Self Resonant Frequency: 14MHz; Core Material: Composite; Max DC Current: 7A; Test Frequency: 100kHz; DC Resistance (DCR): 29.82mR; Package Quantity: 21; Length: 6.76mm; RoHS Compliant: Yes; Min Operating Temperature: -40°C; Tolerance: 20%; Max Operating Temperature: 125°C; Series: XAL6060; Termination: SMD/SMT; Shielding: Shielded; Height: 6.1mm; Lead Free: Contains Lead; Width: 6.56mm; Packaging: Tape and Reel; Inductance: 10uH
MotorReady Status TX = LTST-C190GKT: MF: {'manufacturer': u'Lite-On Inc.'}; Package: None; Price: None; Value: *; MP: LTST-C190GKT; Availability: Unavailable
PAN1 TILT1 = PRT-14417: Description; Manufacturer_Name: Sparkfun; Copyright: Copyright (C) 2026 Ultra Librarian. All rights reserved.; Manufacturer_Part_Number: PRT-14417; RefDes: RefDes; Type: Type
PBRA1 PBRB1 RX1 SOL+1 SOL-1 SOL_CTRL1 TBRA1 TBRB1 TX1 UART1 VM_M1 VM_M2 = RCWCTE: - PC Test Point - - Plating Surface Mount Mounting Type; MF: KOA Speer; Check_prices: https://www.snapeda.com/parts/RCWCTE/KOA+Speer/view-part/?ref=eda; SnapEDA_Link: https://www.snapeda.com/parts/RCWCTE/KOA+Speer/view-part/?ref=snap; Digi-Key_Part_Number: 2019-RCWCTETR-ND; Value: *; Purchase-URL: https://pricing.snapeda.com/search/part/RCWCTE/?ref=eda; Package: None; MP: RCWCTE
PIR1-PIR3 = S3B-PH-K-S: Connector Header Through Hole, Right Angle 3 position 0.079 (2.00mm); MF: JST Sales; SnapEDA_Link: https://www.snapeda.com/parts/S3B-PH-K-S/JST/view-part/?ref=snap; Package: NON STANDARD-3 J.S.T.; Value: *; MP: S3B-PH-K-S; Check_prices: https://www.snapeda.com/parts/S3B-PH-K-S/JST/view-part/?ref=eda
Q1 = IRLML6344: Insulated-Gate Field-Effect Transistor (IGFET), N-Channel, Enhancement, Body Diode, Pin 1 Gate, 2 Source, 3 Drain, 3 Pins; Manufacturer: Infineon Technologies; Manufacturer Order Number: IRLML6344; PackageReference: PG-SOT23-3-901
R1 = CMP-009-00069-2: 931K 0603 (1608 Metric)  SMD; Power: 100mW; Tolerance: 5%; Mounting Technology: SMT; Case/Package: 0603; Pins: 2
R2 = CMP-009-00064-2: 13K 0402 (1005 Metric)  SMD; Power: 63mW; Tolerance: 1%; Value: 13K; Case/Package: 0402; Mounting Technology: SMT; Pins: 2
R3 R8 = CMP-2001-03173-1: Manufacturer: Susumu; Part Number: RL1220S-R82-F
R4 = CMP-009-00064-2: 44.2K 0402 (1005 Metric)  SMD; Power: 63mW; Tolerance: 1%; Value: 44.2K; Case/Package: 0402; Mounting Technology: SMT; Pins: 2
R5 = CMP-009-00064-2: 6.04K 0402 (1005 Metric)  SMD; Power: 63mW; Tolerance: 1%; Value: 6.04K; Case/Package: 0402; Mounting Technology: SMT; Pins: 2
R6 R7 = CMP-2001-03173-1: Manufacturer: Susumu; Part Number: RL1220S-R82-F
R9 = CMP-2002-08407-2: RES Thick Film, 24.9kΩ, 1%, 0.063W, 100ppm/°C, 0402; Voltage Rating (DC): 50V; Resistance: 24.9kR; Power Rating: 63mW; Temperature Coefficient: 100ppm/°C; Case/Package: 0402; Length: 1mm; Radiation Hardening: No; Case Code (Imperial): 0402; Lead Free: Lead Free; Military Standard: Not; Composition: Thick Film; Tolerance: 1%; Min Operating Temperature: -55°C; Height: 0.35mm; Mount: Surface Mount; Max Operating Temperature: 155°C; Packaging: Tape and Reel; Case Code (Metric): 1005; Number of Terminations: 2; Contact Plating: Tin; Voltage Rating: 50V; Weight: 2.3E-05oz; Termination: SMD/SMT; Width: 0.5mm; Max Power Dissipation: 63mW; Number of Pins: 2; Features: Automotive AEC-Q200; Depth: 0.5mm; Package Quantity: 10
R10 R18 R20 = CMP-2002-08123-3: RES Thick Film, 100kΩ, 1%, 0.063W, 100ppm/°C, 0402; Power Rating: 63mW; Resistance: 100kR; Voltage Rating (DC): 50V; Lead Free: Lead Free; Height: 0.35mm; Contact Plating: Tin; Min Operating Temperature: -55°C; Package Quantity: 10000; Case/Package: 0402; Temperature Coefficient: 100ppm/°C; Number of Terminations: 2; Packaging: Tape and Reel; Max Power Dissipation: 63mW; Case Code (Metric): 1005; Mount: Surface Mount; Width: 0.02inch; Termination: SMD/SMT; Length: 1mm; Number of Pins: 2; Weight: 2.3E-05oz; Radiation Hardening: No; Tolerance: 1%; Military Standard: Not; Features: Automotive AEC-Q200; Depth: 0.5mm; Composition: Thick Film; Max Operating Temperature: 155°C; Voltage Rating: 50V; Case Code (Imperial): 0402
R11 = CMP-009-00065-2: 100R 0.063W 1% 0402 (1005 Metric)  SMD; Power: 63mW; Tolerance: 1%; Case/Package: 0402; Pins: 2; Mounting Technology: SMT
R12 = CMP-009-00066-2: 10K 0.063W 1% 0402 (1005 Metric)  SMD; Power: 63mW; Case/Package: 0402; Mounting Technology: SMT; Pins: 2; Tolerance: 1%
R13 R27 = CMP-009-00009-5: Chip Resistor, 1 KOhm, +/- 1%, 0.1 W, -55 to 155 degC, 0402 (1005 Metric); Power: 100mW; Voltage Rating: 50V; Min Operating Temperature: -55°C; Max Operating Temperature: 155°C; RoHS Compliant: True; Mounting Technology: SM; Pins: 2; Tolerance: 1%; Case/Package: 0402
R14 = CMP-009-00015-5: Chip Resistor, 10 KOhm, +/- 1%, 0.1 W, -55 to 155 degC, 0402 (1005 Metric); Voltage Rating: 50V; Power: 100mW; Case/Package: 0402; RoHS Compliant: True; Min Operating Temperature: -55°C; Mounting Technology: SM; Tolerance: 1%; Max Operating Temperature: 155°C; Pins: 2
R15-R17 = CMP-009-00096-2: 33R 0.063W 5% 0402 (1005 Metric)  SMD; Power: 63mW; Mounting Technology: SMT; Tolerance: 5%; Case/Package: 0402; Pins: 2
R19 R21 R23 R25 R26 R28 = CMP-009-00084-2: 240R 0.063W 5% 0402 (1005 Metric)  SMD; Power: 63mW; Pins: 2; Case/Package: 0402; Mounting Technology: SMT; Tolerance: 5%
R22 R24 R29 = CMP-009-00069-2: 120R 0.1W 5% 0603 (1608 Metric)  SMD; Power: 100mW; Mounting Technology: SMT; Tolerance: 5%; Case/Package: 0603; Pins: 2
RN1 = YC124-JR-07100RL: 100 Ohm Â±5% 62.5mW Power Per Element Isolated 4 Resistor Network/Array Â±200ppm/Â°C 0804, Convex, Long Side Terminals; MF: Yageo; SnapEDA_Link: https://www.snapeda.com/parts/YC124-JR-07100RL/Yageo/view-part/?ref=snap; Package: SMD-8 Yageo; Value: *; MP: YC124-JR-07100RL; Check_prices: https://www.snapeda.com/parts/YC124-JR-07100RL/Yageo/view-part/?ref=eda
RN2 = YC124-JR-07100RL: 100K Ohm Â±5% 62.5mW Power Per Element Isolated 4 Resistor Network/Array Â±200ppm/Â°C 0804, Convex, Long Side Terminals; MF: Yageo; SnapEDA_Link: https://www.snapeda.com/parts/YC124-JR-07100RL/Yageo/view-part/?ref=snap; Package: SMD-8 Yageo; Value: *; MP: YC124-JR-07100RL; Check_prices: https://www.snapeda.com/parts/YC124-JR-07100RL/Yageo/view-part/?ref=eda
U1 = TPS26602PWPR: 4.2-V to 60-V, 150m&Omega;, 0.1-2.23A eFuse with integrated input reverse polarity protection 16-HTSSOP -40 to 125; Manufacturer_Name: Texas Instruments; TYPE: TYPE; RefDes: RefDes; Copyright: Copyright (C) 2025 Ultra Librarian. All rights reserved.; Manufacturer_Part_Number: TPS26602PWPR
U2 U3 = TMC2209-LA: Bipolar Motor Driver Power MOSFET Step/Direction, UART 28-QFN (5x5); MF: Maxim Integrated Products; SnapEDA_Link: https://www.snapeda.com/parts/TMC2209-LA/Maxim+Integrated/view-part/?ref=snap; Package: None; Value: *; MP: TMC2209-LA; Check_prices: https://www.snapeda.com/parts/TMC2209-LA/Maxim+Integrated/view-part/?ref=eda
U4 = LMR33630ARNXR: MF: {'manufacturer': u'Texas Instruments'}; Package: None; Price: None; Value: *; MP: LMR33630ARNXR; Availability: Unavailable
U5 = SN74LVC2G14IDCKRQ1: Automotive 2-ch, 1.65-V to 5.5-V inverters with Schmitt-Trigger inputs; MF: Texas Instruments; SnapEDA_Link: https://www.snapeda.com/parts/SN74LVC2G14IDCKRQ1/Texas+Instruments/view-part/?ref=snap; Package: SOT-SC70-6 Texas Instruments; Value: *; MP: SN74LVC2G14IDCKRQ1; Check_prices: https://www.snapeda.com/parts/SN74LVC2G14IDCKRQ1/Texas+Instruments/view-part/?ref=eda
U6 U7 = RB520S30T5G: Description; Manufacturer_Name: onsemi; Copyright: Copyright (C) 2025 Ultra Librarian. All rights reserved.; Manufacturer_Part_Number: RB520S30T5G; RefDes: RefDes; Type: Type